# Altium schematic sheet 30_USB_Interface.SchDoc: Interfaz USB
size A4; DrawnBy: Mateo Cárdenas; Revision: Rev A; SheetNumber: 4; SheetTotal: 7
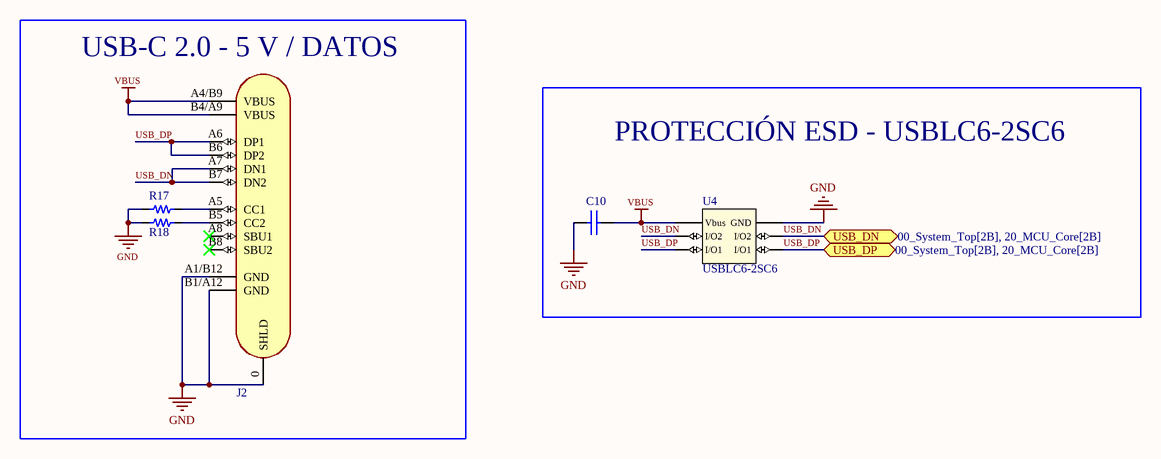
[diagram p0: 30_USB_Interface.SchDoc]

## Parts
C10  0.1uF 50V  [0603_cap]  (value not drawn)
J2  USB C  [CON_USB_C_16P_RA]  (value not drawn)
R17  4k7 1/10W  [0603_res]  (value not drawn)
R18  4k7 1/10W  [0603_res]  (value not drawn)
U4  USBLC6-2SC6  [SOT_23_6]

## Blocks framed on the sheet
USB-C 2.0 - 5 V / DATOS: J2 R17 R18
PROTECCIÓN ESD - USBLC6-2SC6: C10 U4

## Ports
USB_DN (bidir, see 00_System_Top[2B], 20_MCU_Core[2B]), USB_DP (bidir, see 00_System_Top[2B], 20_MCU_Core[2B])

## Nets
GND: C10.2 J2.0(SHLD) J2.A1/B12(GND) J2.B1/A12(GND) R17.1 R18.1 U4.2(GND)
VBUS: C10.1 J2.A4/B9(VBUS) J2.B4/A9(VBUS) U4.5(Vbus)
USB_DN: J2.A7(DN1) J2.B7(DN2) U4.3(I/O2) U4.4(I/O2) ; port USB_DN
USB_DP: J2.A6(DP1) J2.B6(DP2) U4.1(I/O1) U4.6(I/O1) ; port USB_DP
NetJ2_A5: J2.A5(CC1) R17.2
NetJ2_B5: J2.B5(CC2) R18.2

Not connected (* = marked no-connect by the designer): J2 A8(SBU1)* B8(SBU2)*

## Library data of the parts
C10 = Cap_0.1uF_0603_50V: 50V 100nF Y5V -20%~+80% 0603 Multilayer Ceramic Capacitors MLCC - SMD/SMT ROHS; Manufacturer: Walsin Tech Corp; Manufacturer Part Number: 0603F104Z500CT; Supplier 1: LCSC; Supplier Part Number 1: C83060; ComponentLink1Description: LCSC; ComponentLink1URL: https://www.lcsc.com/product-detail/Multilayer-Ceramic-Capacitors-MLCC-SMD-SMT_Walsin-Tech-Corp-0603F104Z500CT_C83060.html; Value: 0.1uF
J2 = CON_USB_TYPEC_16P: 3A USB 3.1 1 Surface Mount 16P Female -40℃~+85℃ Type-C SMD USB Connectors ROHS; Manufacturer: SHOU HAN; Manufacturer Part Number: TYPE-C-3.1-16PIN; Supplier 1: LCSC; Supplier Part Number 1: C7507405; ComponentLink1Description: LCSC; ComponentLink1URL: https://lcsc.com/product-detail/USB-Connectors_SHOU-HAN-TYPE-C-3-1-16PIN_C7507405.html
R17 R18 = Res_4k7_0603_1/10W: 100mW Thick Film Resistor 75V ±1% 4.7kΩ 0603 Chip Resistor - Surface Mount ROHS; Manufacturer: VO; Manufacturer Part Number: SCR0603F4K7; ComponentLink1URL: https://lcsc.com/product-detail/Chip-Resistor-Surface-Mount_VO-SCR0603F4K7_C3016318.html; Supplier 1: LCSC; Supplier Part Number 1: C3016318; ComponentLink1Description: LCSC; Value: 4k7
U4 = TVS_5.25V_2CH_SOT_23_6: TVS DIODE 5.25V 17V SOT23-6; Manufacturer: STMicroelectronics; ComponentLink1Description: LCSC; ComponentLink1URL: https://www.lcsc.com/product-detail/ESD-Protection-Devices_STMicroelectronics-USBLC6-2SC6_C7519.html; Supplier 1: LCSC; Manufacturer Part Number: USBLC6-2SC6; Supplier Part Number 1: C7519